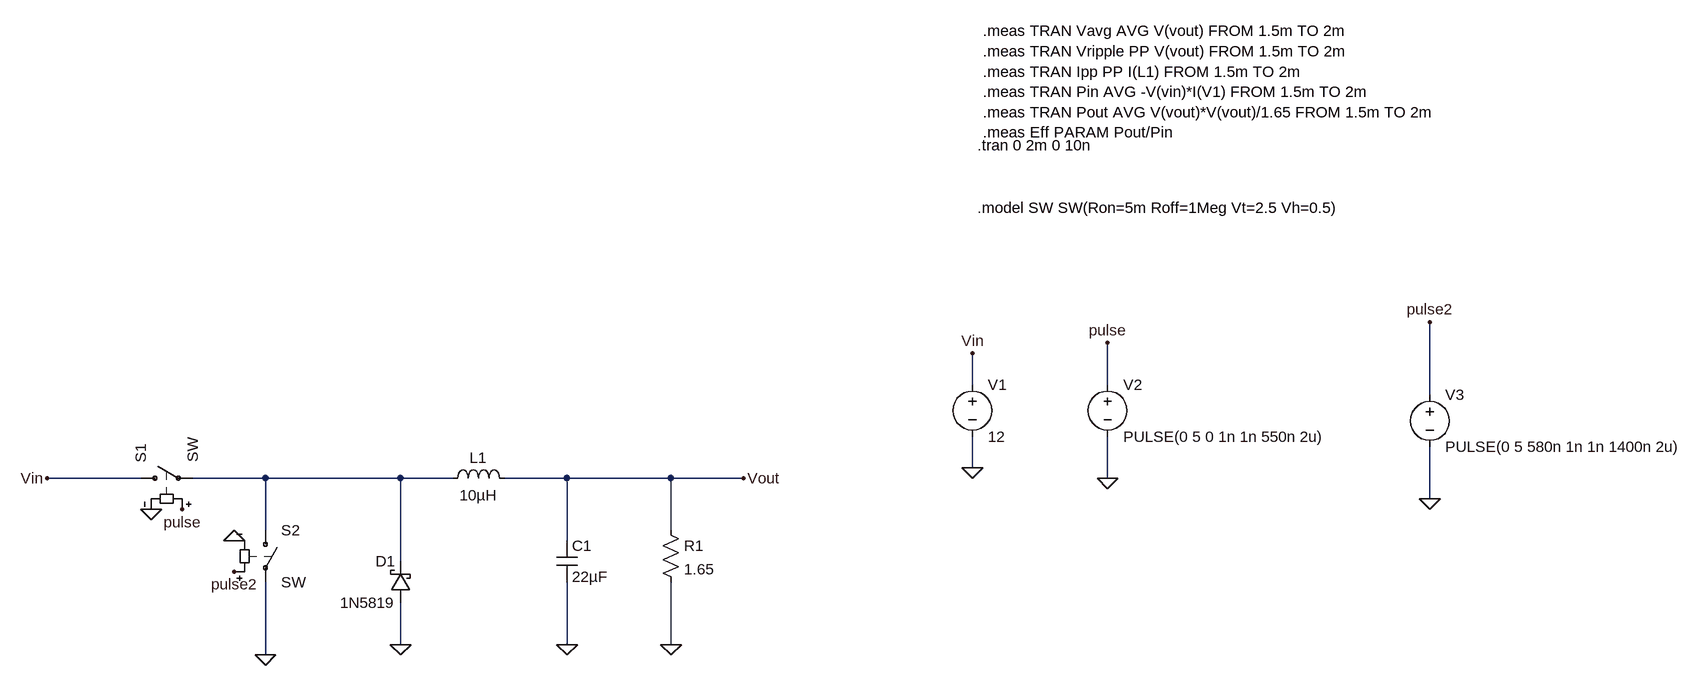
[diagram p0: schematic Buck_ideal.asc]
Buck_ideal.asc, the LTspice schematic file:
Version 4.1
SHEET 1 1612 680
WIRE 496 96 496 48
WIRE 704 96 704 32
WIRE 1200 112 1200 0
WIRE 496 224 496 176
WIRE -784 240 -928 240
WIRE -592 240 -704 240
WIRE -384 240 -592 240
WIRE -304 240 -384 240
WIRE -128 240 -224 240
WIRE 32 240 -128 240
WIRE 144 240 32 240
WIRE 704 240 704 176
WIRE 1200 272 1200 192
WIRE -592 320 -592 240
WIRE 32 320 32 240
WIRE -128 336 -128 240
WIRE -384 368 -384 240
WIRE -384 496 -384 432
WIRE -128 496 -128 400
WIRE 32 496 32 400
WIRE -592 512 -592 400
FLAG 496 224 0
FLAG 496 48 Vin
FLAG 704 240 0
FLAG 704 32 pulse
FLAG -768 288 0
FLAG -720 288 pulse
FLAG -928 240 Vin
FLAG -384 496 0
FLAG -128 496 0
FLAG 32 496 0
FLAG 144 240 Vout
FLAG -640 336 0
FLAG -592 512 0
FLAG 1200 272 0
FLAG 1200 0 pulse2
FLAG -640 384 pulse2
SYMBOL voltage 496 80 R0
WINDOW 123 0 0 Left 0
WINDOW 39 0 0 Left 0
SYMATTR InstName V1
SYMATTR Value 12
SYMBOL voltage 704 80 R0
WINDOW 123 0 0 Left 0
WINDOW 39 0 0 Left 0
SYMATTR InstName V2
SYMATTR Value PULSE(0 5 0 1n 1n 550n 2u)
SYMBOL sw -800 240 R270
SYMATTR InstName S1
SYMBOL schottky -368 432 R180
WINDOW 0 24 64 Left 2
WINDOW 3 24 0 Left 2
SYMATTR InstName D1
SYMATTR Value 1N5819
SYMBOL ind -320 256 R270
WINDOW 0 32 56 VTop 2
WINDOW 3 5 56 VBottom 2
SYMATTR InstName L1
SYMATTR Value 10µH
SYMATTR SpiceLine Rser=1m
SYMBOL cap -144 336 R0
SYMATTR InstName C1
SYMATTR Value 22µF
SYMBOL res 16 304 R0
SYMATTR InstName R1
SYMATTR Value 1.65
SYMBOL sw -592 304 R0
SYMATTR InstName S2
SYMBOL voltage 1200 96 R0
WINDOW 123 0 0 Left 0
WINDOW 39 0 0 Left 0
SYMATTR InstName V3
SYMATTR Value PULSE(0 5 580n 1n 1n 1400n 2u)
TEXT 504 -176 Left 2 !.model SW SW(Ron=5m Roff=1Meg Vt=2.5 Vh=0.5)
TEXT 504 -272 Left 2 !.tran 0 2m 0 10n
TEXT 512 -448 Left 2 !.meas TRAN Vavg AVG V(vout) FROM 1.5m TO 2m\n.meas TRAN Vripple PP V(vout) FROM 1.5m TO 2m\n.meas TRAN Ipp PP I(L1) FROM 1.5m TO 2m\n.meas TRAN Pin AVG -V(vin)*I(V1) FROM 1.5m TO 2m\n.meas TRAN Pout AVG V(vout)*V(vout)/1.65 FROM 1.5m TO 2m\n.meas Eff PARAM Pout/Pin

The netlist it stands for:
* Buck_ideal.asc
V1 Vin 0 12
V2 pulse 0 PULSE(0 5 0 1n 1n 550n 2u)
S1 Vin N001 pulse 0 SW
D1 0 N001 1N5819
L1 N001 Vout 10µH Rser=1m
C1 Vout 0 22µF
R1 Vout 0 1.65
S2 N001 0 pulse2 0 SW
V3 pulse2 0 PULSE(0 5 580n 1n 1n 1400n 2u)
.model D D
.lib standard.dio
.model SW SW(Ron=5m Roff=1Meg Vt=2.5 Vh=0.5)
.tran 0 2m 0 10n
.meas TRAN Vavg AVG V(vout) FROM 1.5m TO 2m
.meas TRAN Vripple PP V(vout) FROM 1.5m TO 2m
.meas TRAN Ipp PP I(L1) FROM 1.5m TO 2m
.meas TRAN Pin AVG -V(vin)*I(V1) FROM 1.5m TO 2m
.meas TRAN Pout AVG V(vout)*V(vout)/1.65 FROM 1.5m TO 2m
.meas Eff PARAM Pout/Pin
.backanno
.end